# Altium project DT10965_MOTOR_CONTROLLER.PrjPcb (part 1 of 4)
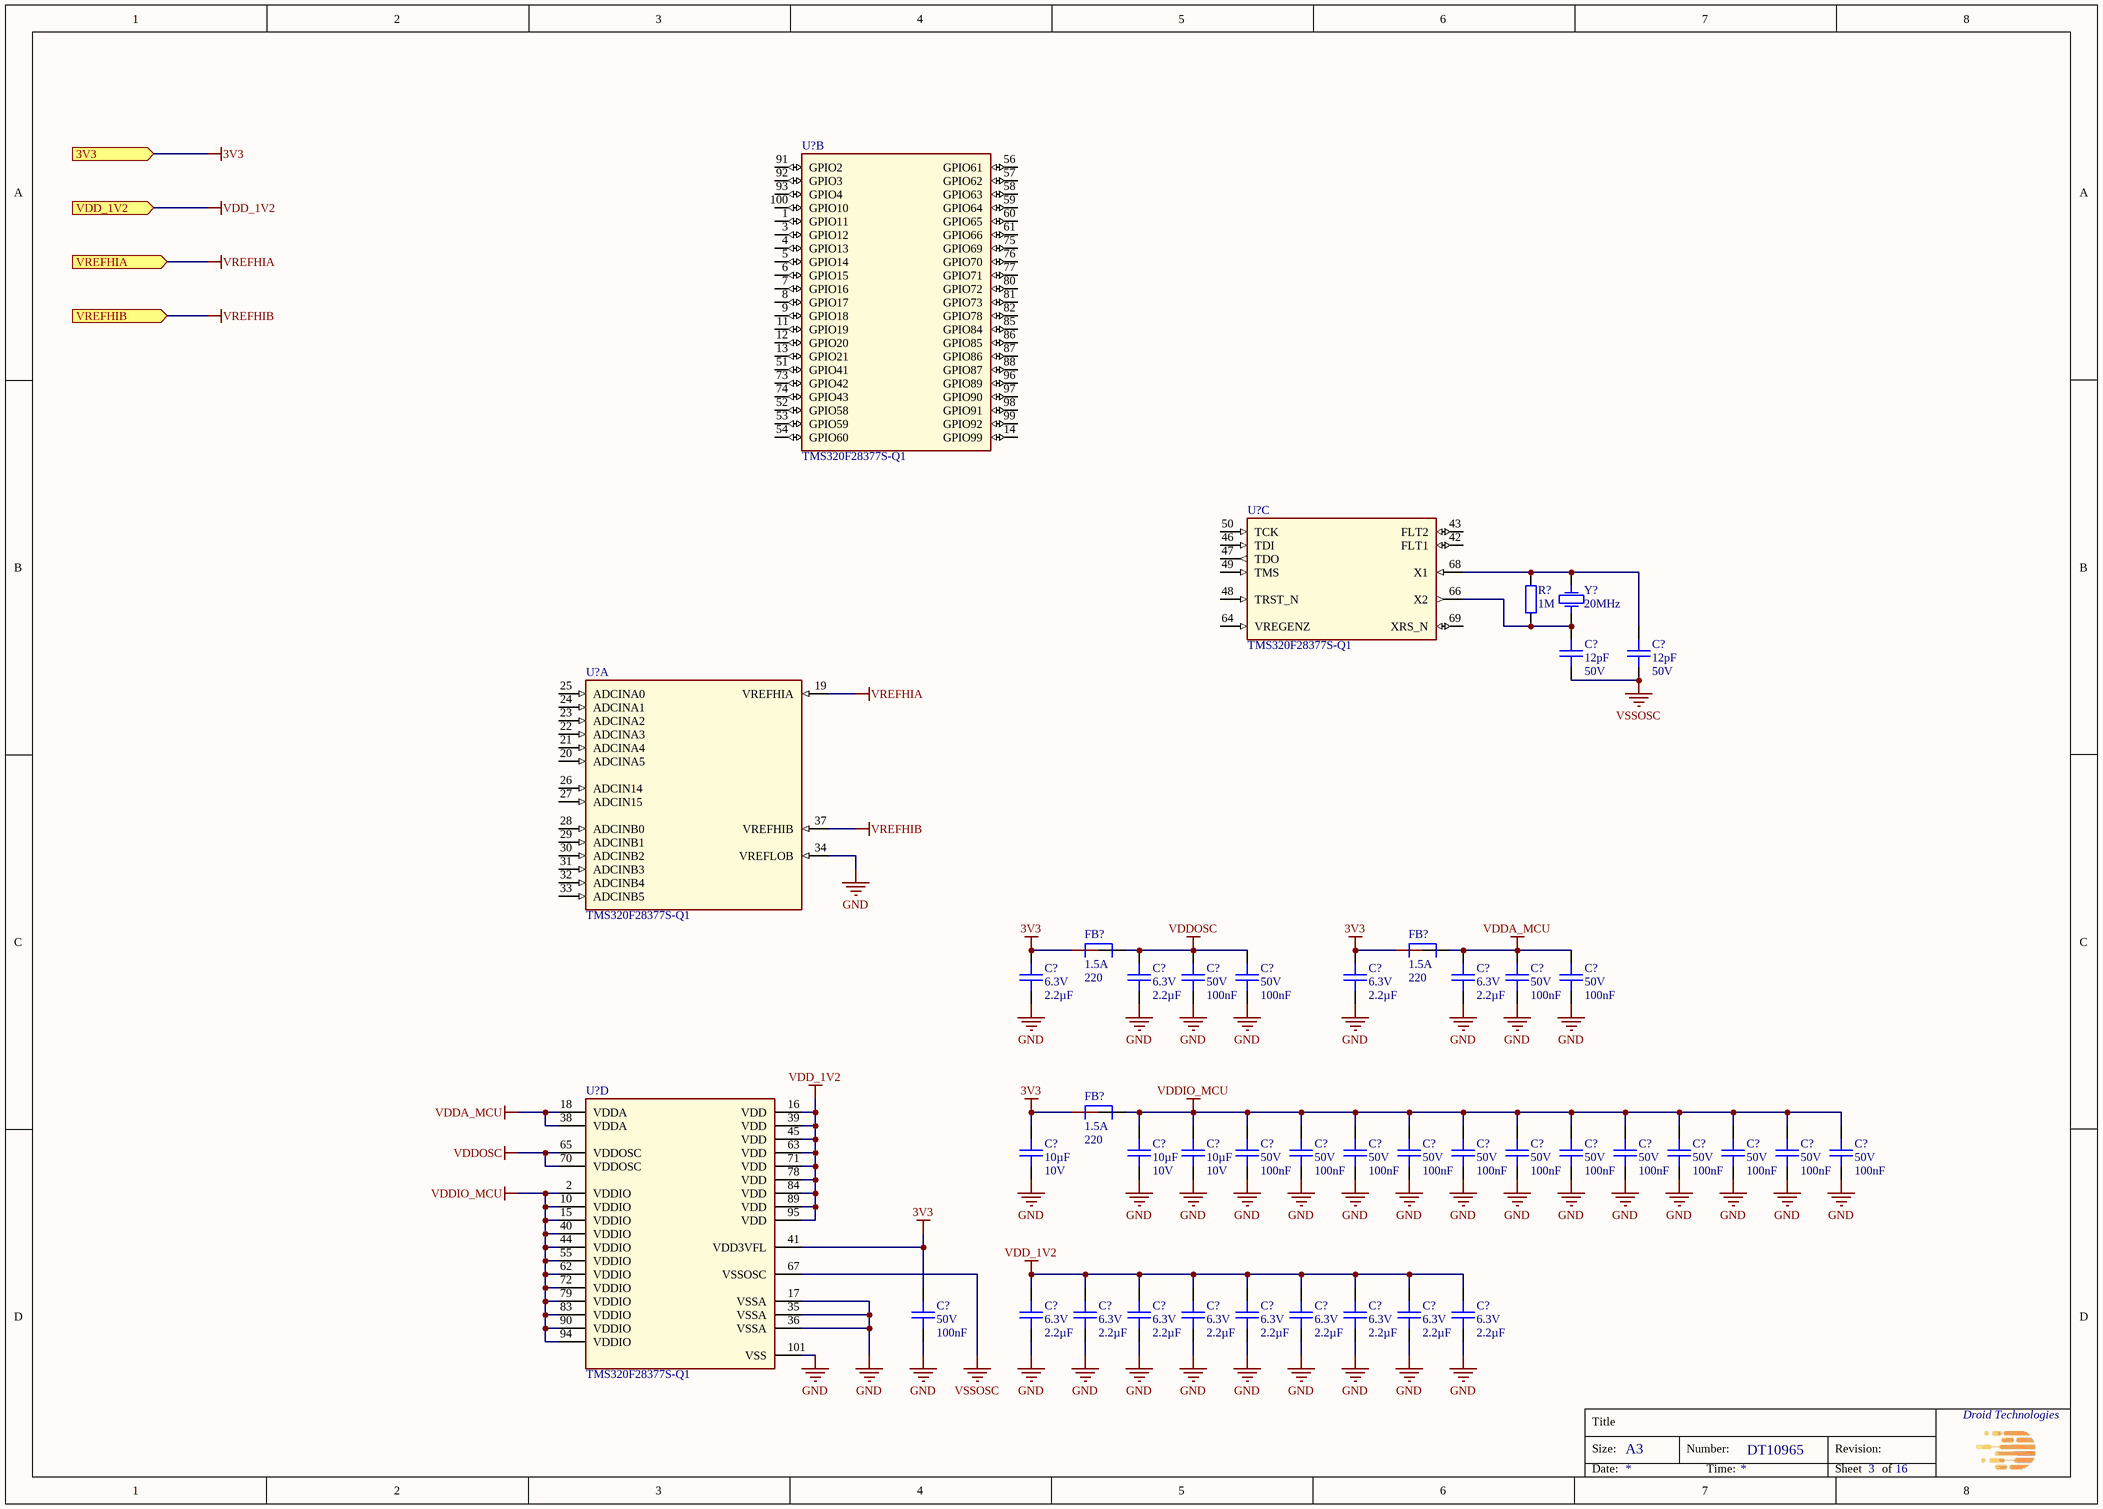
[diagram p0: MCU.SchDoc]
CompanyName: Droid Technologies; DT_PCB_Number: DT10966; DT_PCB_Revision: 1.0; DT_SCH_Number: DT10965; DT_SCH_Revision: 1.0; DT_SCH_Title: MOTORCONTROLLER
16 sheets, 439 parts. Net scope: flat (ports and power ports of the same name join across sheets).
Sheets:
  Title.SchDoc
  Block_Diagram.SchDoc
  MCU.SchDoc
  MCU_debug.SchDoc
  Flash_memory.SchDoc
  EEPROM_memory.SchDoc
  Temp_sensor.SchDoc
  Accelerometers.SchDoc
  H-bridge.SchDoc
  Phase Current_Voltage Sense.SchDoc
  Resolver.SchDoc
  Pressure_sensor_AFE.SchDoc
  Calendar.SchDoc
  Current_sensor.SchDoc
  USB_interface.SchDoc
  Power_management.SchDoc

## Sheet Title.SchDoc: =DT_SCH_Title
size A4; Organization: Droid Technologies; DocumentNumber: DT10965; Revision: 1.0

### Notes on the sheet
- SCHEMATIC MAJOR REVISION HISTORY
- SCH (PCBA) Part Number:
- PCB MAJOR REVISION HISTORY
- PCB Part Number:
- REVISION
- SUBREVISION
- CHANGE DESCRIPTION
- YYYY/MM/DD
- Title
- Size:
- A4
- Number:
- Revision:
- Date:
- Time:
- Sheet
- of

## Sheet Block_Diagram.SchDoc: =DT_SCH_Title
size A4; Organization: Droid Technologies; DocumentNumber: DT10965; Revision: 1.0

### Notes on the sheet
- Title
- Size:
- A4
- Number:
- Revision:
- Date:
- Time:
- Sheet
- of

## Sheet MCU.SchDoc: =DT_SCH_Title
size A3; Organization: Droid Technologies; DocumentNumber: DT10965; Revision: 1.0; SheetNumber: 3; SheetTotal: 16

### Parts
(Parts that share a designator on the sheet are numbered #1, #2 ... from top to bottom, then left to right.)
C?#1  Capacitance: 12pF  Voltage Rating: 50V  [CAPC100x50x50L25]  (hidden comment: C0402C120J5HACAUTO)
C?#2  Capacitance: 12pF  Voltage Rating: 50V  [CAPC100x50x50L25]  (hidden comment: C0402C120J5HACAUTO)
C?#3  Voltage Rating: 6.3V  Capacitance: 2.2µF  [CAPC160X80X90L35]  (hidden comment: C1608X8L0J225K080AC)
C?#4  Voltage Rating: 6.3V  Capacitance: 2.2µF  [CAPC160X80X90L35]  (hidden comment: C1608X8L0J225K080AC)
C?#5  Voltage Rating: 50V  Capacitance: 100nF  [CAPC100x50x50L25]  (hidden comment: GCM155L8EH104KE07D)
C?#6  Voltage Rating: 50V  Capacitance: 100nF  [CAPC100x50x50L25]  (hidden comment: GCM155L8EH104KE07D)
C?#7  Voltage Rating: 6.3V  Capacitance: 2.2µF  [CAPC160X80X90L35]  (hidden comment: C1608X8L0J225K080AC)
C?#8  Voltage Rating: 6.3V  Capacitance: 2.2µF  [CAPC160X80X90L35]  (hidden comment: C1608X8L0J225K080AC)
C?#9  Voltage Rating: 50V  Capacitance: 100nF  [CAPC100x50x50L25]  (hidden comment: GCM155L8EH104KE07D)
C?#10  Voltage Rating: 50V  Capacitance: 100nF  [CAPC100x50x50L25]  (hidden comment: GCM155L8EH104KE07D)
C?#11  Capacitance: 10µF  Voltage Rating: 10V  [CAPC200X125X145L50]  (hidden comment: CGA4J1X8L1A106K125AC)
C?#12  Capacitance: 10µF  Voltage Rating: 10V  [CAPC200X125X145L50]  (hidden comment: CGA4J1X8L1A106K125AC)
C?#13  Capacitance: 10µF  Voltage Rating: 10V  [CAPC200X125X145L50]  (hidden comment: CGA4J1X8L1A106K125AC)
C?#14  Voltage Rating: 50V  Capacitance: 100nF  [CAPC100x50x50L25]  (hidden comment: GCM155L8EH104KE07D)
C?#15  Voltage Rating: 50V  Capacitance: 100nF  [CAPC100x50x50L25]  (hidden comment: GCM155L8EH104KE07D)
C?#16  Voltage Rating: 50V  Capacitance: 100nF  [CAPC100x50x50L25]  (hidden comment: GCM155L8EH104KE07D)
C?#17  Voltage Rating: 50V  Capacitance: 100nF  [CAPC100x50x50L25]  (hidden comment: GCM155L8EH104KE07D)
C?#18  Voltage Rating: 50V  Capacitance: 100nF  [CAPC100x50x50L25]  (hidden comment: GCM155L8EH104KE07D)
C?#19  Voltage Rating: 50V  Capacitance: 100nF  [CAPC100x50x50L25]  (hidden comment: GCM155L8EH104KE07D)
C?#20  Voltage Rating: 50V  Capacitance: 100nF  [CAPC100x50x50L25]  (hidden comment: GCM155L8EH104KE07D)
C?#21  Voltage Rating: 50V  Capacitance: 100nF  [CAPC100x50x50L25]  (hidden comment: GCM155L8EH104KE07D)
C?#22  Voltage Rating: 50V  Capacitance: 100nF  [CAPC100x50x50L25]  (hidden comment: GCM155L8EH104KE07D)
C?#23  Voltage Rating: 50V  Capacitance: 100nF  [CAPC100x50x50L25]  (hidden comment: GCM155L8EH104KE07D)
C?#24  Voltage Rating: 50V  Capacitance: 100nF  [CAPC100x50x50L25]  (hidden comment: GCM155L8EH104KE07D)
C?#25  Voltage Rating: 50V  Capacitance: 100nF  [CAPC100x50x50L25]  (hidden comment: GCM155L8EH104KE07D)
C?#26  Voltage Rating: 50V  Capacitance: 100nF  [CAPC100x50x50L25]  (hidden comment: GCM155L8EH104KE07D)
C?#27  Voltage Rating: 6.3V  Capacitance: 2.2µF  [CAPC160X80X90L35]  (hidden comment: C1608X8L0J225K080AC)
C?#28  Voltage Rating: 6.3V  Capacitance: 2.2µF  [CAPC160X80X90L35]  (hidden comment: C1608X8L0J225K080AC)
C?#29  Voltage Rating: 6.3V  Capacitance: 2.2µF  [CAPC160X80X90L35]  (hidden comment: C1608X8L0J225K080AC)
C?#30  Voltage Rating: 6.3V  Capacitance: 2.2µF  [CAPC160X80X90L35]  (hidden comment: C1608X8L0J225K080AC)
C?#31  Voltage Rating: 6.3V  Capacitance: 2.2µF  [CAPC160X80X90L35]  (hidden comment: C1608X8L0J225K080AC)
C?#32  Voltage Rating: 6.3V  Capacitance: 2.2µF  [CAPC160X80X90L35]  (hidden comment: C1608X8L0J225K080AC)
C?#33  Voltage Rating: 6.3V  Capacitance: 2.2µF  [CAPC160X80X90L35]  (hidden comment: C1608X8L0J225K080AC)
C?#34  Voltage Rating: 6.3V  Capacitance: 2.2µF  [CAPC160X80X90L35]  (hidden comment: C1608X8L0J225K080AC)
C?#35  Voltage Rating: 6.3V  Capacitance: 2.2µF  [CAPC160X80X90L35]  (hidden comment: C1608X8L0J225K080AC)
FB?#1  Imax: 1.5A  Impedance: 220  [BEADC160X80X95L40]  (hidden comment: BLM18KG221BH1D)
FB?#2  Imax: 1.5A  Impedance: 220  [BEADC160X80X95L40]  (hidden comment: BLM18KG221BH1D)
FB?#3  Imax: 1.5A  Impedance: 220  [BEADC160X80X95L40]  (hidden comment: BLM18KG221BH1D)
R?#1  Resistance: 1M  [RESC100X50X40L25]  (hidden comment: RC0402FR-071ML)
U?#1  TMS320F28377S-Q1  [100-HTQFP (14x14)]  (part B of 4)
U?#2  TMS320F28377S-Q1  [100-HTQFP (14x14)]  (part C of 4)
U?#3  TMS320F28377S-Q1  [100-HTQFP (14x14)]  (part A of 4)
U?#4  TMS320F28377S-Q1  [100-HTQFP (14x14)]  (part D of 4)
Y?#1  20MHz  [NX5032GA]

### Ports
3V3 (in), VDD_1V2 (in), VREFHIA (in), VREFHIB (in)

### Nets
3V3: C?#3.2 C?#7.2 C?#11.2 C?#26.2 FB?#1.1 FB?#2.1 FB?#3.1 U?#4.41(VDD3VFL) ; port 3V3
GND: C?#3.1 C?#4.1 C?#5.1 C?#6.1 C?#7.1 C?#8.1 C?#9.1 C?#10.1 C?#11.1 C?#12.1 C?#13.1 C?#14.1 C?#15.1 C?#16.1 C?#17.1 C?#18.1 C?#19.1 C?#20.1 C?#21.1 C?#22.1 C?#23.1 C?#24.1 C?#25.1 C?#26.1 C?#27.1 C?#28.1 C?#29.1 C?#30.1 C?#31.1 C?#32.1 C?#33.1 C?#34.1 C?#35.1 U?#3.34(VREFLOB) U?#4.17(VSSA) U?#4.35(VSSA) U?#4.36(VSSA) U?#4.101(VSS)
VDD_1V2: C?#27.2 C?#28.2 C?#29.2 C?#30.2 C?#31.2 C?#32.2 C?#33.2 C?#34.2 C?#35.2 U?#4.16(VDD) U?#4.39(VDD) U?#4.45(VDD) U?#4.63(VDD) U?#4.71(VDD) U?#4.78(VDD) U?#4.84(VDD) U?#4.89(VDD) U?#4.95(VDD) ; port VDD_1V2
VDDA_MCU: C?#8.2 C?#9.2 C?#10.2 FB?#2.2 U?#4.18(VDDA) U?#4.38(VDDA)
VDDIO_MCU: C?#12.2 C?#13.2 C?#14.2 C?#15.2 C?#16.2 C?#17.2 C?#18.2 C?#19.2 C?#20.2 C?#21.2 C?#22.2 C?#23.2 C?#24.2 C?#25.2 FB?#3.2 U?#4.2(VDDIO) U?#4.10(VDDIO) U?#4.15(VDDIO) U?#4.40(VDDIO) U?#4.44(VDDIO) U?#4.55(VDDIO) U?#4.62(VDDIO) U?#4.72(VDDIO) U?#4.79(VDDIO) U?#4.83(VDDIO) U?#4.90(VDDIO) U?#4.94(VDDIO)
VDDOSC: C?#4.2 C?#5.2 C?#6.2 FB?#1.2 U?#4.65(VDDOSC) U?#4.70(VDDOSC)
VREFHIA: U?#3.19(VREFHIA) ; port VREFHIA
VREFHIB: U?#3.37(VREFHIB) ; port VREFHIB
VSSOSC: C?#1.2 C?#2.2 U?#4.67(VSSOSC)
NetC?#1_1: C?#1.1 R?#1.1 U?#2.66(X2) Y?#1.1
NetC?#2_1: C?#2.1 R?#1.2 U?#2.68(X1) Y?#1.2

Not connected (* = marked no-connect by the designer): U?#1 1(GPIO11) 3(GPIO12) 4(GPIO13) 5(GPIO14) 6(GPIO15) 7(GPIO16) 8(GPIO17) 9(GPIO18) 11(GPIO19) 12(GPIO20) 13(GPIO21) 14(GPIO99) 51(GPIO41) 52(GPIO58) 53(GPIO59) 54(GPIO60) 56(GPIO61) 57(GPIO62) 58(GPIO63) 59(GPIO64) 60(GPIO65) 61(GPIO66) 73(GPIO42) 74(GPIO43) 75(GPIO69) 76(GPIO70) 77(GPIO71) 80(GPIO72) 81(GPIO73) 82(GPIO78) 85(GPIO84) 86(GPIO85) 87(GPIO86) 88(GPIO87) 91(GPIO2) 92(GPIO3) 93(GPIO4) 96(GPIO89) 97(GPIO90) 98(GPIO91) 99(GPIO92) 100(GPIO10); U?#2 42(FLT1) 43(FLT2) 46(TDI) 47(TDO) 48(TRST_N) 49(TMS) 50(TCK) 64(VREGENZ) 69(XRS_N); U?#3 20(ADCINA5) 21(ADCINA4) 22(ADCINA3) 23(ADCINA2) 24(ADCINA1) 25(ADCINA0) 26(ADCIN14) 27(ADCIN15) 28(ADCINB0) 29(ADCINB1) 30(ADCINB2) 31(ADCINB3) 32(ADCINB4) 33(ADCINB5)

### Notes on the sheet
- Title
- Size:
- A3
- Number:
- Revision:
- Date:
- Time:
- Sheet
- of

### Library data of the parts
C?#1 C?#2 = CMP-001-2042-1: CAP CER 0402 12PF 50V ULTRA STAB; Manufacturer: KEMET; Tolerance: 5%; Op Temp min: -55°C; Dielectric: X8R; Op Temp max: 155°C; ComponentLink3URL: https://www.digikey.com/en/products/detail/kemet/C0402C120J5HACAUTO/7955501; ComponentLink1Description: Datasheet; ComponentLink2URL: https://eu.mouser.com/ProductDetail/KEMET/C0402C120J5HACAUTO?qs=j%252B1pi9TdxUZTSOjjZ2f5wA%3D%3D; Size: 1.00mm x 0.50mm; ComponentLink2Description: Mouser; Ratings: AEC-Q200; ComponentLink3Description: Digikey; Mounting Type: SM; Lead Spacing: 0mm; MPN: C0402C120J5HACAUTO; ComponentLink1URL: https://content.kemet.com/datasheets/KEM_C1007_X8R_ULTRA_150C_SMD.pdf; Height max: 500µm; Package: 0402 (1005 Metric)
C?#3 C?#4 C?#7 C?#8 C?#27-C?#35 = CMP-001-2044-1: CAP CER 2.2UF 6.3V X8L 0603; Manufacturer: TDK Corporation; Op Temp min: -55°C; Tolerance: 10%; Op Temp max: 150°C; ComponentLink1URL: https://product.tdk.com/en/search/capacitor/ceramic/mlcc/info?part_no=C1608X8L0J225K080AC; MPN: C1608X8L0J225K080AC; ComponentLink3URL: https://www.digikey.com/en/products/detail/tdk-corporation/C1608X8L0J225K080AC/8343784; ComponentLink1Description: Datasheet; Lead Spacing: 0mm; ComponentLink3Description: Digikey; Package: 0603 (1608 Metric); Height max: 900µm; Size: 1.60mm x 0.80mm; Dielectric: X8L; Ratings: -; Mounting Type: SM; ComponentLink2URL: https://eu.mouser.com/ProductDetail/TDK/C1608X8L0J225K080AC?qs=rrS6PyfT74dgREMaiAoT3Q%3D%3D; ComponentLink2Description: Mouser
C?#5 C?#6 C?#9 C?#10 C?#14-C?#26 = CMP-001-1980-1: CAP CER 0.1UF 50V X8L 0402; Manufacturer: Murata Electronics; Op Temp max: 150°C; Op Temp min: -55°C; Tolerance: 10%; Height max: 550µm; ComponentLink3Description: Digikey; Mounting Type: SM; ComponentLink3URL: https://www.digikey.com/en/products/detail/murata-electronics/GCM155L8EH104KE07D/11618823; Package: 0402 (1005 Metric); Lead Spacing: 0mm; MPN: GCM155L8EH104KE07D; Size: 1.00mm x 0.50mm; Ratings: AEC-Q200; ComponentLink1URL: https://search.murata.co.jp/Ceramy/image/img/A01X/G101/ENG/GCM155L8EH104KE07-01.pdf; ComponentLink1Description: Datasheet; Dielectric: X8L; ComponentLink2Description: Mouser; ComponentLink2URL: https://eu.mouser.com/ProductDetail/Murata-Electronics/GCM155L8EH104KE07D?qs=1mbolxNpo8fQSHf0HYnZWw%3D%3D
C?#11-C?#13 = CMP-001-1984-1: CAP CER 10UF 10V X8L 0805; Manufacturer: TDK Corporation; Tolerance: 10%; Op Temp min: -55°C; Op Temp max: 150°C; ComponentLink3Description: Digikey; Mounting Type: SM; Ratings: AEC-Q200; ComponentLink1Description: Datasheet; ComponentLink3URL: https://www.digikey.com/en/products/detail/tdk-corporation/CGA4J1X8L1A106K125AC/9991388; Lead Spacing: 0mm; MPN: CGA4J1X8L1A106K125AC; Size: 2.00mm x 1.25mm; Height max: 1.5mm; ComponentLink2URL: https://eu.mouser.com/ProductDetail/TDK/CGA4J1X8L1A106K125AC?qs=gZXFycFWdANzH%252B2UvJJjtQ%3D%3D; Package: 0805 (2012 Metric); ComponentLink2Description: Mouser; Dielectric: X8L; ComponentLink1URL: https://product.tdk.com/system/files/dam/doc/product/capacitor/ceramic/mlcc/catalog/mlcc_automotive_hightemp_en.pdf
FB?#1-FB?#3 = CMP-001-1981-1: FERRITE BEAD 220 OHM 0603 1LN; Manufacturer: Murata Electronics; DCR: 50m; Op Temp min: -55°C; Frequency: 100MHz; Op Temp max: 150°C; Number of Lines: 1; Mounting Type: SM; Size: 1.60mm x 0.80mm; ComponentLink2URL: https://eu.mouser.com/ProductDetail/Murata-Electronics/BLM18KG221BH1D?qs=sJ5gq5MLFXpgEHYBdWUtkQ%3D%3D; ComponentLink1Description: Datasheet; ComponentLink1URL: https://www.murata.com/en-us/products/productdata/8798137286686/QNFA9129.pdf; Lead Spacing: 0mm; Ratings: AEC-Q200; ComponentLink3Description: Digikey; ComponentLink3URL: https://www.digikey.com/en/products/detail/murata-electronics/BLM18KG221BH1D/6156000; Height max: 950µm; Package: 0603 (1608 Metric); ComponentLink2Description: Mouser; MPN: BLM18KG221BH1D
R?#1 = CMP-00539-4: RES 1M OHM 1% 1/16W 0402; Manufacturer: YAGEO; Op Temp max: 155°C; Op Temp min: -55°C; Temperature Coefficient: ±100ppm; Power: 63mW; Ratings: -; ComponentLink2URL: https://eu.mouser.com/ProductDetail/YAGEO/RC0402FR-071ML?qs=V1yeUXFNrknfoI4987wfBQ%3D%3D; Height max: 400µm; ComponentLink1Description: Datasheet; Mounting Type: SM; ComponentLink2Description: Mouser; Package: 0402 (1005 Metric); ComponentLink3URL: https://www.digikey.com/en/products/detail/yageo/RC0402FR-071ML/726515; MPN: RC0402FR-071ML; Tolerance: 1%; ComponentLink1URL: https://www.yageo.com/upload/media/product/productsearch/datasheet/rchip/PYu-RC_Group_51_RoHS_L_12.pdf; Composition: Thick Film; Size: 1.00mm x 0.50mm; ComponentLink3Description: Digikey
U?#1-U?#4 = TMS320F28377SPZPQ: IC MCU 32BIT 1MB FLASH 100HTQFP; Manufacturer: Texas Instruments; MPN: TMS320F28377SPZPQ
Y?#1 = STDCSU2-20M: CRYSTAL 20.0000MHZ 8PF SMD; Manufacturer: NDK (NIHON DEMPA KOGYO CO., LTD); MPN: STDCSU2-20M

## Sheet MCU_debug.SchDoc: =DT_SCH_Title
size A4; Organization: Droid Technologies; DocumentNumber: DT10965; Revision: 1.0; SheetNumber: 4; SheetTotal: 15
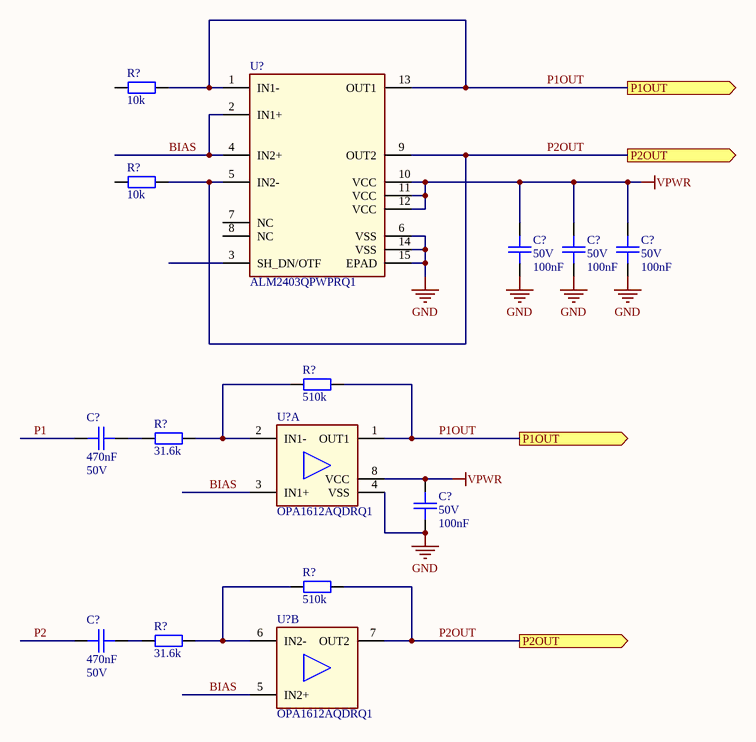
[diagram p1: MCU_debug.SchDoc]

### Parts
(Parts that share a designator on the sheet are numbered #1, #2 ... from top to bottom, then left to right.)
C?#36  Voltage Rating: 50V  Capacitance: 100nF  [CAPC100x50x50L25]  (hidden comment: GCM155L8EH104KE07D)
C?#37  Voltage Rating: 50V  Capacitance: 100nF  [CAPC100x50x50L25]  (hidden comment: GCM155L8EH104KE07D)
C?#38  Voltage Rating: 50V  Capacitance: 100nF  [CAPC100x50x50L25]  (hidden comment: GCM155L8EH104KE07D)
C?#39  Capacitance: 470nF  Voltage Rating: 50V  [CAPC200X125X145L50]  (hidden comment: CGA4J1X8L1H474K125AC)
C?#40  Voltage Rating: 50V  Capacitance: 100nF  [CAPC100x50x50L25]  (hidden comment: GCM155L8EH104KE07D)
C?#41  Capacitance: 470nF  Voltage Rating: 50V  [CAPC200X125X145L50]  (hidden comment: CGA4J1X8L1H474K125AC)
R?#2  Resistance: 10k  [RESC100X50X40L25]  (hidden comment: RC0402FR-0710KL)
R?#3  Resistance: 10k  [RESC100X50X40L25]  (hidden comment: RC0402FR-0710KL)
R?#4  Resistance: 510k  [RESC100X50X40L25]  (hidden comment: RC0402FR-07510KL)
R?#5  Resistance: 31.6k  [RESC100X50X40L25]  (hidden comment: RC0402FR-0731K6L)
R?#6  Resistance: 510k  [RESC100X50X40L25]  (hidden comment: RC0402FR-07510KL)
R?#7  Resistance: 31.6k  [RESC100X50X40L25]  (hidden comment: RC0402FR-0731K6L)
U?#5  ALM2403QPWPRQ1  [14-HTSSOP]
U?#6  OPA1612AQDRQ1  [SOIC8P127_490X600X175L70X41]  (part A of 2)
U?#7  OPA1612AQDRQ1  [SOIC8P127_490X600X175L70X41]  (part B of 2)

### Ports
P1OUT (out), P2OUT (out)

### Nets
GND: C?#36.1 C?#37.1 C?#38.1 C?#40.1 U?#5.6(VSS) U?#5.14(VSS) U?#5.15(EPAD) U?#6.4(VSS)
VPWR: C?#36.2 C?#37.2 C?#38.2 C?#40.2 U?#5.10(VCC) U?#5.11(VCC) U?#5.12(VCC) U?#6.8(VCC)
BIAS: U?#5.2(IN1+) U?#5.4(IN2+) U?#6.3(IN1+) U?#7.5(IN2+)
P1: C?#39.2
P1OUT: R?#2.1 R?#4.2 U?#5.1(IN1-) U?#5.13(OUT1) U?#6.1(OUT1) ; port P1OUT
P2: C?#41.2
P2OUT: R?#3.1 R?#6.2 U?#5.5(IN2-) U?#5.9(OUT2) U?#7.7(OUT2) ; port P2OUT
NetC?#39_1: C?#39.1 R?#5.1
NetC?#41_1: C?#41.1 R?#7.1
NetR?#4_1: R?#4.1 R?#5.2 U?#6.2(IN1-)
NetR?#6_1: R?#6.1 R?#7.2 U?#7.6(IN2-)

Not connected (* = marked no-connect by the designer): R?#2 2; R?#3 2; U?#5 3(SH_DN/OTF) 7(NC) 8(NC)

### Notes on the sheet
- Title
- Size:
- A4
- Number:
- Revision:
- Date:
- Time:
- Sheet
- of

### Library data of the parts
C?#36-C?#38 C?#40 = CMP-001-1980-1: as C?#5 on sheet MCU; Height max: 550µm; ComponentLink3Description: Digikey; Mounting Type: SM; ComponentLink3URL: https://www.digikey.com/en/products/detail/murata-electronics/GCM155L8EH104KE07D/11618823; Package: 0402 (1005 Metric); Lead Spacing: 0mm; MPN: GCM155L8EH104KE07D; Size: 1.00mm x 0.50mm; Ratings: AEC-Q200; ComponentLink1URL: https://search.murata.co.jp/Ceramy/image/img/A01X/G101/ENG/GCM155L8EH104KE07-01.pdf; ComponentLink1Description: Datasheet; Dielectric: X8L; ComponentLink2Description: Mouser; ComponentLink2URL: https://eu.mouser.com/ProductDetail/Murata-Electronics/GCM155L8EH104KE07D?qs=1mbolxNpo8fQSHf0HYnZWw%3D%3D
C?#39 C?#41 = CMP-001-2015-1: CAP CER 0.47UF 50V X8L 0805; Manufacturer: TDK Corporation; Op Temp min: -55°C; Tolerance: 10%; Op Temp max: 150°C; ComponentLink1Description: Datasheet; Size: 2.00mm x 1.25mm; Dielectric: X8L; ComponentLink3URL: https://www.digikey.com/en/products/detail/tdk-corporation/CGA4J1X8L1H474K125AC/12807037?s=N4IgjCBcoKxaBjKAzAhgGwM4FMA0IB7KAbRAGYYAWAdgA5KQBdfABwBcoQBlNgJwEsAdgHMQAX3xgG0EEkhoseQiRAAmMrWoamrDpG58hoieABs8WSgw58RSKTIBOMqsc6Q7TjwEjx%2BU24ycgo2yvYglAAMjpRg5sweegY%2BxviqMKoWwdZKdqSqlK5kEGmFztQgpa6xlWpllLTunvreRn7gjrSBiFaKtiqRTCaqkZTdlvI5-eGRAHQ0AAQArQBitTSRC4JrCc0gAKqC-GwA8sgAstiomACuvNjtALSZQVB8N7kqcPhujCaP4zk70%2B4QgfzEYiAA; Ratings: AEC-Q200; ComponentLink3Description: Digikey; ComponentLink2Description: Mouser; Mounting Type: SM; Lead Spacing: 0mm; ComponentLink1URL: https://product.tdk.com/system/files/dam/doc/product/capacitor/ceramic/mlcc/catalog/mlcc_automotive_hightemp_en.pdf; MPN: CGA4J1X8L1H474K125AC; Height max: 1.45mm; ComponentLink2URL: https://eu.mouser.com/ProductDetail/TDK/CGA4J1X8L1H474K125AC?qs=W%2FMpXkg%252BdQ5d8zdfD6mokw%3D%3D; Package: 0805 (2012 Metric)
R?#2 R?#3 = CMP-00010-6: RES 10K OHM 1% 1/16W 0402; Manufacturer: YAGEO; Op Temp max: 155°C; Op Temp min: -55°C; Power: 63mW; Temperature Coefficient: ±100ppm; ComponentLink3URL: https://www.digikey.com/en/products/detail/yageo/RC0402FR-0710KL/726523; ComponentLink1Description: Datasheet; Height max: 400µm; ComponentLink3Description: Digikey; ComponentLink2URL: https://www2.mouser.com/ProductDetail/YAGEO/RC0402FR-0710KL?qs=%2Fha2pyFaduhjtLcYvKXQ8NAGbRXkQ%2Fwl6RsvWHeV66MSeqLhkcF3rg%3D%3D; Ratings: -; MPN: RC0402FR-0710KL; ComponentLink1URL: https://www.yageo.com/upload/media/product/productsearch/datasheet/rchip/PYu-RC_Group_51_RoHS_L_12.pdf; ComponentLink2Description: Mouser; Mounting Type: SM; Tolerance: 1%; Composition: Thick Film; Size: 1.00mm x 0.50mm; Package: 0402 (1005 Metric)
R?#4 R?#6 = CMP-001-0533-6: RES 510K OHM 1% 1/16W 0402; Manufacturer: YAGEO; Op Temp max: 155°C; Temperature Coefficient: ±100ppm; Op Temp min: -55°C; Power: 63mW; Package: 0402 (1005 Metric); Composition: Thick Film; Size: 1.00mm x 0.50mm; ComponentLink2Description: Mouser; MPN: RC0402FR-07510KL; Height max: 400µm; ComponentLink1URL: https://www.yageo.com/upload/media/product/productsearch/datasheet/rchip/PYu-RC_Group_51_RoHS_L_12.pdf; ComponentLink2URL: https://eu.mouser.com/ProductDetail/YAGEO/RC0402FR-07510KL?qs=V1yeUXFNrkkq0IeA5n8CcA%3D%3D; Tolerance: 1%; Mounting Type: SM; ComponentLink3Description: Digikey; ComponentLink3URL: https://www.digikey.com/en/products/detail/yageo/RC0402FR-07510KL/726631; Ratings: -; ComponentLink1Description: Datasheet
R?#5 R?#7 = CMP-00475-6: RES 31.6K OHM 1% 1/16W 0402; Manufacturer: YAGEO; Power: 63mW; Temperature Coefficient: ±100ppm; Op Temp max: 155°C; Op Temp min: -55°C; ComponentLink2Description: Mouser; Size: 1.00mm x 0.50mm; ComponentLink3URL: https://www.digikey.com/en/products/detail/yageo/RC0402FR-0731K6L/5280975; Composition: Thick Film; Mounting Type: SM; ComponentLink1URL: https://www.yageo.com/upload/media/product/productsearch/datasheet/rchip/PYu-RC_Group_51_RoHS_L_12.pdf; Tolerance: 1%; ComponentLink3Description: Digikey; MPN: RC0402FR-0731K6L; ComponentLink1Description: Datasheet; Ratings: -; ComponentLink2URL: https://eu.mouser.com/ProductDetail/YAGEO/RC0402FR-0731K6L?qs=tQYgeJ5sXdm2wsAqEjplmg%3D%3D; Package: 0402 (1005 Metric); Height max: 400µm
U?#5 = ALM2403QPWPRQ1: IC OPAMP GP 2 CIRCUIT 14HTSSOP; Manufacturer: Texas Instruments; MPN: ALM2403QPWPRQ1
U?#6 U?#7 = CMP-001-2012-1: IC AUDIO 2 CIRCUIT 8SOIC; Manufacturer: Texas Instruments; Vmax: 36V; Op Temp min: -40°C; Io: 62mA; Output Type: Rail-to-Rail; Vmin: 4.5V; Vos: 100µV; SR: 27V/µs; Op Temp max: 125°C; GBW: 80MHz; Number of Circuits: 2; ComponentLink2Description: Mouser; ComponentLink2URL: https://eu.mouser.com/ProductDetail/Texas-Instruments/OPA1612AQDRQ1?qs=8%2FmU9qzJpL88MwkHDflokw%3D%3D; Mounting Type: SM; Ratings: AEC-Q100; ComponentLink1Description: Datasheet; ComponentLink3Description: Digikey; Package: 8-SOIC (0.154", 3.90mm Width); ComponentLink3URL: https://www.digikey.com/en/products/detail/texas-instruments/OPA1612AQDRQ1/5773903?s=N4IgjCBcoEwKwyqAxlAZgQwDYGcCmANCAPZQDaIMYMALAOwAcIAukQA4AuUIAyhwE4BLAHYBzEAF8iAWkTQQqSAICuhEuRBwQRAJwsJUyhoDyABQCCYAGzV9QA; MPN: OPA1612AQDRQ1; ComponentLink1URL: https://www.ti.com/lit/ds/symlink/opa1612-q1.pdf?HQS=dis-dk-null-digikeymode-dsf-pf-null-wwe&ts=1746955758664&ref_url=https%253A%252F%252Fwww.ti.com%252Fgeneral%252Fdocs%252Fsuppproductinfo.tsp%253FdistId%253D10%2526gotoUrl%253Dhttps%253A%252F%252Fwww.ti.com%252Flit%252Fgpn%252Fopa1612-q1

## Sheet Flash_memory.SchDoc: =DT_SCH_Title
size A3; Organization: Droid Technologies; DocumentNumber: DT10965; Revision: 1.0
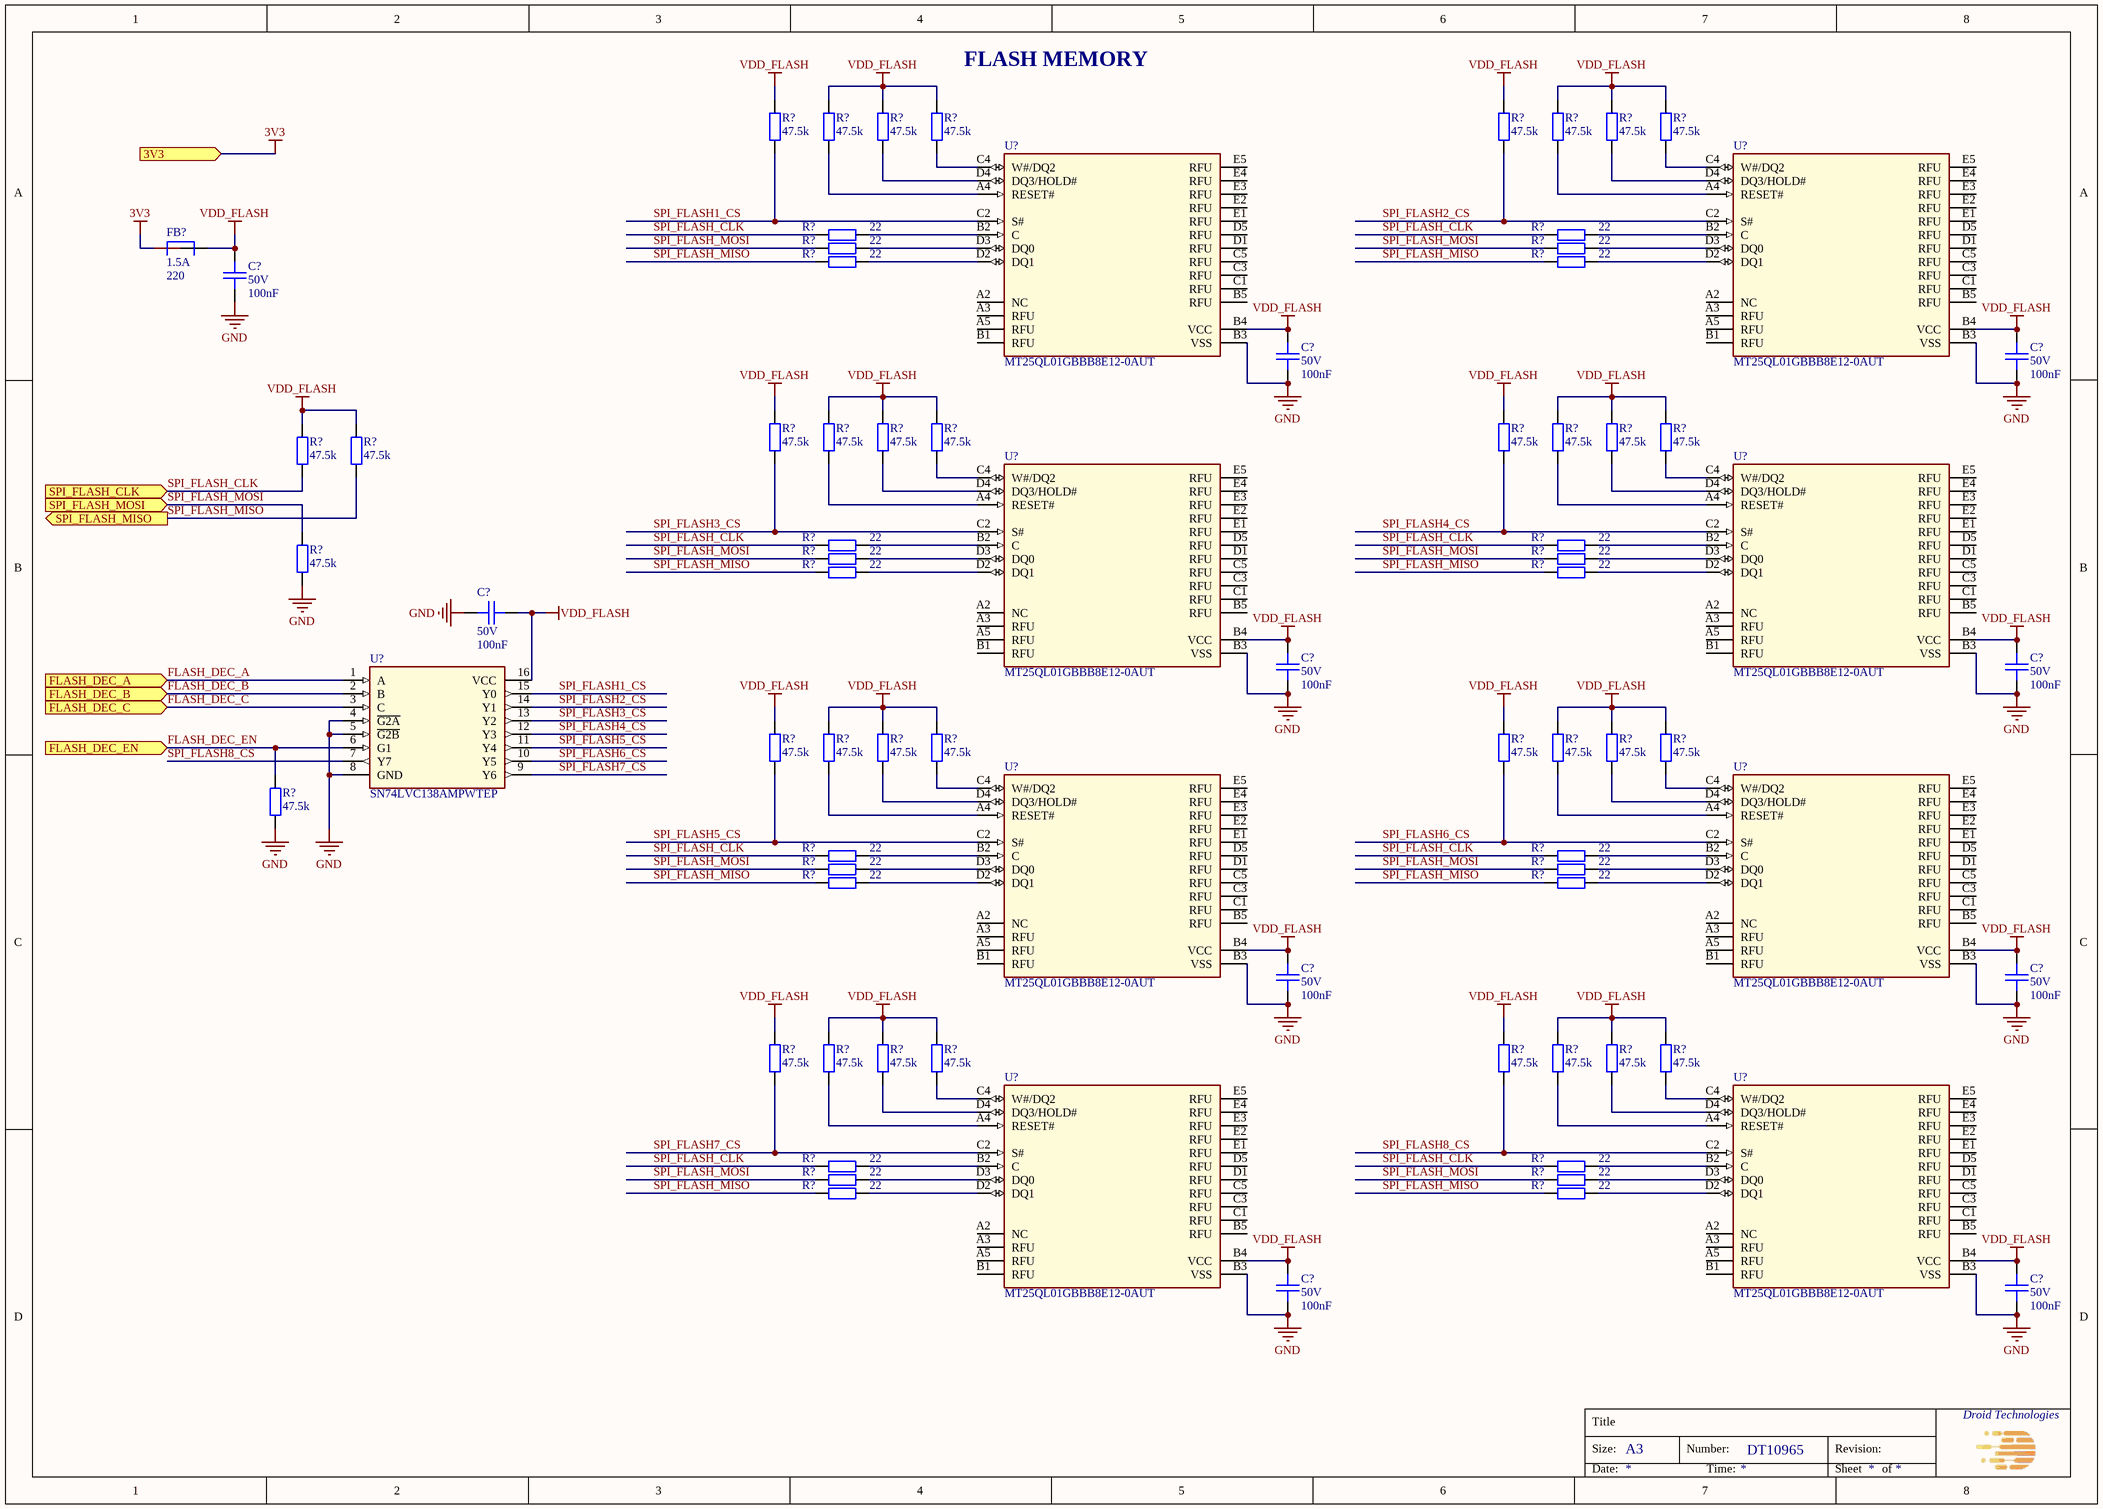
[diagram p2: Flash_memory.SchDoc]

### Parts
(Parts that share a designator on the sheet are numbered #1, #2 ... from top to bottom, then left to right.)
C?#42  Voltage Rating: 50V  Capacitance: 100nF  [CAPC100x50x50L25]  (hidden comment: GCM155L8EH104KE07D)
C?#43  Voltage Rating: 50V  Capacitance: 100nF  [CAPC100x50x50L25]  (hidden comment: GCM155L8EH104KE07D)
C?#44  Voltage Rating: 50V  Capacitance: 100nF  [CAPC100x50x50L25]  (hidden comment: GCM155L8EH104KE07D)
C?#45  Voltage Rating: 50V  Capacitance: 100nF  [CAPC100x50x50L25]  (hidden comment: GCM155L8EH104KE07D)
C?#46  Voltage Rating: 50V  Capacitance: 100nF  [CAPC100x50x50L25]  (hidden comment: GCM155L8EH104KE07D)
C?#47  Voltage Rating: 50V  Capacitance: 100nF  [CAPC100x50x50L25]  (hidden comment: GCM155L8EH104KE07D)
C?#48  Voltage Rating: 50V  Capacitance: 100nF  [CAPC100x50x50L25]  (hidden comment: GCM155L8EH104KE07D)
C?#49  Voltage Rating: 50V  Capacitance: 100nF  [CAPC100x50x50L25]  (hidden comment: GCM155L8EH104KE07D)
C?#50  Voltage Rating: 50V  Capacitance: 100nF  [CAPC100x50x50L25]  (hidden comment: GCM155L8EH104KE07D)
C?#51  Voltage Rating: 50V  Capacitance: 100nF  [CAPC100x50x50L25]  (hidden comment: GCM155L8EH104KE07D)
FB?#4  Imax: 1.5A  Impedance: 220  [BEADC160X80X95L40]  (hidden comment: BLM18KG221BH1D)
R?#8  Resistance: 47.5k  [RESC100X50X40L25]  (hidden comment: RC0402FR-0747K5L)
R?#9  Resistance: 47.5k  [RESC100X50X40L25]  (hidden comment: RC0402FR-0747K5L)
R?#10  Resistance: 47.5k  [RESC100X50X40L25]  (hidden comment: RC0402FR-0747K5L)
R?#11  Resistance: 47.5k  [RESC100X50X40L25]  (hidden comment: RC0402FR-0747K5L)
R?#12  Resistance: 47.5k  [RESC100X50X40L25]  (hidden comment: RC0402FR-0747K5L)
R?#13  Resistance: 47.5k  [RESC100X50X40L25]  (hidden comment: RC0402FR-0747K5L)
R?#14  Resistance: 47.5k  [RESC100X50X40L25]  (hidden comment: RC0402FR-0747K5L)
R?#15  Resistance: 47.5k  [RESC100X50X40L25]  (hidden comment: RC0402FR-0747K5L)
R?#16  Resistance: 22  [RESC100X50X40L25]  (hidden comment: RC0402FR-0722RL)
R?#17  Resistance: 22  [RESC100X50X40L25]  (hidden comment: RC0402FR-0722RL)
R?#18  Resistance: 22  [RESC100X50X40L25]  (hidden comment: RC0402FR-0722RL)
R?#19  Resistance: 22  [RESC100X50X40L25]  (hidden comment: RC0402FR-0722RL)
R?#20  Resistance: 22  [RESC100X50X40L25]  (hidden comment: RC0402FR-0722RL)
R?#21  Resistance: 22  [RESC100X50X40L25]  (hidden comment: RC0402FR-0722RL)
R?#22  Resistance: 47.5k  [RESC100X50X40L25]  (hidden comment: RC0402FR-0747K5L)
R?#23  Resistance: 47.5k  [RESC100X50X40L25]  (hidden comment: RC0402FR-0747K5L)
R?#24  Resistance: 47.5k  [RESC100X50X40L25]  (hidden comment: RC0402FR-0747K5L)
R?#25  Resistance: 47.5k  [RESC100X50X40L25]  (hidden comment: RC0402FR-0747K5L)
R?#26  Resistance: 47.5k  [RESC100X50X40L25]  (hidden comment: RC0402FR-0747K5L)
R?#27  Resistance: 47.5k  [RESC100X50X40L25]  (hidden comment: RC0402FR-0747K5L)
R?#28  Resistance: 47.5k  [RESC100X50X40L25]  (hidden comment: RC0402FR-0747K5L)
R?#29  Resistance: 47.5k  [RESC100X50X40L25]  (hidden comment: RC0402FR-0747K5L)
R?#30  Resistance: 47.5k  [RESC100X50X40L25]  (hidden comment: RC0402FR-0747K5L)
R?#31  Resistance: 47.5k  [RESC100X50X40L25]  (hidden comment: RC0402FR-0747K5L)
R?#32  Resistance: 22  [RESC100X50X40L25]  (hidden comment: RC0402FR-0722RL)
R?#33  Resistance: 22  [RESC100X50X40L25]  (hidden comment: RC0402FR-0722RL)
R?#34  Resistance: 22  [RESC100X50X40L25]  (hidden comment: RC0402FR-0722RL)
R?#35  Resistance: 22  [RESC100X50X40L25]  (hidden comment: RC0402FR-0722RL)
R?#36  Resistance: 22  [RESC100X50X40L25]  (hidden comment: RC0402FR-0722RL)
R?#37  Resistance: 22  [RESC100X50X40L25]  (hidden comment: RC0402FR-0722RL)
R?#38  Resistance: 47.5k  [RESC100X50X40L25]  (hidden comment: RC0402FR-0747K5L)
R?#39  Resistance: 47.5k  [RESC100X50X40L25]  (hidden comment: RC0402FR-0747K5L)
R?#40  Resistance: 47.5k  [RESC100X50X40L25]  (hidden comment: RC0402FR-0747K5L)
R?#41  Resistance: 47.5k  [RESC100X50X40L25]  (hidden comment: RC0402FR-0747K5L)
R?#42  Resistance: 47.5k  [RESC100X50X40L25]  (hidden comment: RC0402FR-0747K5L)
R?#43  Resistance: 47.5k  [RESC100X50X40L25]  (hidden comment: RC0402FR-0747K5L)
R?#44  Resistance: 47.5k  [RESC100X50X40L25]  (hidden comment: RC0402FR-0747K5L)
R?#45  Resistance: 47.5k  [RESC100X50X40L25]  (hidden comment: RC0402FR-0747K5L)
R?#46  Resistance: 47.5k  [RESC100X50X40L25]  (hidden comment: RC0402FR-0747K5L)
R?#47  Resistance: 47.5k  [RESC100X50X40L25]  (hidden comment: RC0402FR-0747K5L)
R?#48  Resistance: 22  [RESC100X50X40L25]  (hidden comment: RC0402FR-0722RL)
R?#49  Resistance: 22  [RESC100X50X40L25]  (hidden comment: RC0402FR-0722RL)
R?#50  Resistance: 22  [RESC100X50X40L25]  (hidden comment: RC0402FR-0722RL)
R?#51  Resistance: 22  [RESC100X50X40L25]  (hidden comment: RC0402FR-0722RL)
R?#52  Resistance: 22  [RESC100X50X40L25]  (hidden comment: RC0402FR-0722RL)
R?#53  Resistance: 22  [RESC100X50X40L25]  (hidden comment: RC0402FR-0722RL)
R?#54  Resistance: 47.5k  [RESC100X50X40L25]  (hidden comment: RC0402FR-0747K5L)
R?#55  Resistance: 47.5k  [RESC100X50X40L25]  (hidden comment: RC0402FR-0747K5L)
R?#56  Resistance: 47.5k  [RESC100X50X40L25]  (hidden comment: RC0402FR-0747K5L)
R?#57  Resistance: 47.5k  [RESC100X50X40L25]  (hidden comment: RC0402FR-0747K5L)
R?#58  Resistance: 47.5k  [RESC100X50X40L25]  (hidden comment: RC0402FR-0747K5L)
R?#59  Resistance: 47.5k  [RESC100X50X40L25]  (hidden comment: RC0402FR-0747K5L)
R?#60  Resistance: 47.5k  [RESC100X50X40L25]  (hidden comment: RC0402FR-0747K5L)
R?#61  Resistance: 47.5k  [RESC100X50X40L25]  (hidden comment: RC0402FR-0747K5L)
R?#62  Resistance: 22  [RESC100X50X40L25]  (hidden comment: RC0402FR-0722RL)
R?#63  Resistance: 22  [RESC100X50X40L25]  (hidden comment: RC0402FR-0722RL)
R?#64  Resistance: 22  [RESC100X50X40L25]  (hidden comment: RC0402FR-0722RL)
R?#65  Resistance: 22  [RESC100X50X40L25]  (hidden comment: RC0402FR-0722RL)
R?#66  Resistance: 22  [RESC100X50X40L25]  (hidden comment: RC0402FR-0722RL)
R?#67  Resistance: 22  [RESC100X50X40L25]  (hidden comment: RC0402FR-0722RL)
U?#8  MT25QL01GBBB8E12-0AUT  [24-T-PBGA (6x8)]
U?#9  MT25QL01GBBB8E12-0AUT  [24-T-PBGA (6x8)]
U?#10  MT25QL01GBBB8E12-0AUT  [24-T-PBGA (6x8)]
U?#11  MT25QL01GBBB8E12-0AUT  [24-T-PBGA (6x8)]
U?#12  SN74LVC138AMPWTEP  [TSSOP16]
U?#13  MT25QL01GBBB8E12-0AUT  [24-T-PBGA (6x8)]
U?#14  MT25QL01GBBB8E12-0AUT  [24-T-PBGA (6x8)]
U?#15  MT25QL01GBBB8E12-0AUT  [24-T-PBGA (6x8)]
U?#16  MT25QL01GBBB8E12-0AUT  [24-T-PBGA (6x8)]

### Ports
3V3 (in), FLASH_DEC_A (in), FLASH_DEC_B (in), FLASH_DEC_C (in), FLASH_DEC_EN (in), SPI_FLASH_CLK (in), SPI_FLASH_MISO (out), SPI_FLASH_MOSI (in)

### Nets
3V3: FB?#4.1 ; port 3V3
GND: C?#42.1 C?#43.1 C?#44.1 C?#45.1 C?#46.1 C?#47.1 C?#48.1 C?#49.1 C?#50.1 C?#51.1 R?#38.1 R?#47.1 U?#8.B3(VSS) U?#9.B3(VSS) U?#10.B3(VSS) U?#11.B3(VSS) U?#12.4(~{G2A}) U?#12.5(~{G2B}) U?#12.8(GND) U?#13.B3(VSS) U?#14.B3(VSS) U?#15.B3(VSS) U?#16.B3(VSS)
VDD_FLASH: C?#42.2 C?#43.2 C?#44.2 C?#45.2 C?#46.2 C?#47.2 C?#48.2 C?#49.2 C?#50.2 C?#51.2 FB?#4.2 R?#8.2 R?#9.2 R?#10.2 R?#11.2 R?#12.2 R?#13.2 R?#14.2 R?#15.2 R?#22.2 R?#23.2 R?#24.2 R?#25.2 R?#26.2 R?#27.2 R?#28.2 R?#29.2 R?#30.2 R?#31.2 R?#39.2 R?#40.2 R?#41.2 R?#42.2 R?#43.2 R?#44.2 R?#45.2 R?#46.2 R?#54.2 R?#55.2 R?#56.2 R?#57.2 R?#58.2 R?#59.2 R?#60.2 R?#61.2 U?#8.B4(VCC) U?#9.B4(VCC) U?#10.B4(VCC) U?#11.B4(VCC) U?#12.16(VCC) U?#13.B4(VCC) U?#14.B4(VCC) U?#15.B4(VCC) U?#16.B4(VCC)
FLASH_DEC_A: U?#12.1(A) ; port FLASH_DEC_A
FLASH_DEC_B: U?#12.2(B) ; port FLASH_DEC_B
FLASH_DEC_C: U?#12.3(C) ; port FLASH_DEC_C
FLASH_DEC_EN: R?#47.2 U?#12.6(G1) ; port FLASH_DEC_EN
SPI_FLASH1_CS: R?#8.1 U?#8.C2(S#) U?#12.15(Y0)
SPI_FLASH2_CS: R?#12.1 U?#9.C2(S#) U?#12.14(Y1)
SPI_FLASH3_CS: R?#22.1 U?#10.C2(S#) U?#12.13(Y2)
SPI_FLASH4_CS: R?#26.1 U?#11.C2(S#) U?#12.12(Y3)
SPI_FLASH5_CS: R?#39.1 U?#12.11(Y4) U?#13.C2(S#)
SPI_FLASH6_CS: R?#43.1 U?#12.10(Y5) U?#14.C2(S#)
SPI_FLASH7_CS: R?#54.1 U?#12.9(Y6) U?#15.C2(S#)
SPI_FLASH8_CS: R?#58.1 U?#12.7(Y7) U?#16.C2(S#)
SPI_FLASH_CLK: R?#16.1 R?#17.1 R?#30.1 R?#32.1 R?#33.1 R?#48.1 R?#49.1 R?#62.1 R?#63.1 ; port SPI_FLASH_CLK
SPI_FLASH_MISO: R?#20.1 R?#21.1 R?#31.1 R?#36.1 R?#37.1 R?#52.1 R?#53.1 R?#66.1 R?#67.1 ; port SPI_FLASH_MISO
SPI_FLASH_MOSI: R?#18.1 R?#19.1 R?#34.1 R?#35.1 R?#38.2 R?#50.1 R?#51.1 R?#64.1 R?#65.1 ; port SPI_FLASH_MOSI
NetR?#9_1: R?#9.1 U?#8.A4(RESET#)
NetR?#10_1: R?#10.1 U?#8.D4(DQ3/HOLD#)
NetR?#11_1: R?#11.1 U?#8.C4(W#/DQ2)
NetR?#13_1: R?#13.1 U?#9.A4(RESET#)
NetR?#14_1: R?#14.1 U?#9.D4(DQ3/HOLD#)
NetR?#15_1: R?#15.1 U?#9.C4(W#/DQ2)
NetR?#16_2: R?#16.2 U?#8.B2(C)
NetR?#17_2: R?#17.2 U?#9.B2(C)
NetR?#18_2: R?#18.2 U?#8.D3(DQ0)
NetR?#19_2: R?#19.2 U?#9.D3(DQ0)
NetR?#20_2: R?#20.2 U?#8.D2(DQ1)
NetR?#21_2: R?#21.2 U?#9.D2(DQ1)
NetR?#23_1: R?#23.1 U?#10.A4(RESET#)
NetR?#24_1: R?#24.1 U?#10.D4(DQ3/HOLD#)
NetR?#25_1: R?#25.1 U?#10.C4(W#/DQ2)
NetR?#27_1: R?#27.1 U?#11.A4(RESET#)
NetR?#28_1: R?#28.1 U?#11.D4(DQ3/HOLD#)
NetR?#29_1: R?#29.1 U?#11.C4(W#/DQ2)
NetR?#32_2: R?#32.2 U?#10.B2(C)
NetR?#33_2: R?#33.2 U?#11.B2(C)
NetR?#34_2: R?#34.2 U?#10.D3(DQ0)
NetR?#35_2: R?#35.2 U?#11.D3(DQ0)
NetR?#36_2: R?#36.2 U?#10.D2(DQ1)
NetR?#37_2: R?#37.2 U?#11.D2(DQ1)
NetR?#40_1: R?#40.1 U?#13.A4(RESET#)
NetR?#41_1: R?#41.1 U?#13.D4(DQ3/HOLD#)
NetR?#42_1: R?#42.1 U?#13.C4(W#/DQ2)
NetR?#44_1: R?#44.1 U?#14.A4(RESET#)
NetR?#45_1: R?#45.1 U?#14.D4(DQ3/HOLD#)
NetR?#46_1: R?#46.1 U?#14.C4(W#/DQ2)
NetR?#48_2: R?#48.2 U?#13.B2(C)
NetR?#49_2: R?#49.2 U?#14.B2(C)
NetR?#50_2: R?#50.2 U?#13.D3(DQ0)
NetR?#51_2: R?#51.2 U?#14.D3(DQ0)
NetR?#52_2: R?#52.2 U?#13.D2(DQ1)
NetR?#53_2: R?#53.2 U?#14.D2(DQ1)
NetR?#55_1: R?#55.1 U?#15.A4(RESET#)
NetR?#56_1: R?#56.1 U?#15.D4(DQ3/HOLD#)
NetR?#57_1: R?#57.1 U?#15.C4(W#/DQ2)
NetR?#59_1: R?#59.1 U?#16.A4(RESET#)
NetR?#60_1: R?#60.1 U?#16.D4(DQ3/HOLD#)
NetR?#61_1: R?#61.1 U?#16.C4(W#/DQ2)
NetR?#62_2: R?#62.2 U?#15.B2(C)
NetR?#63_2: R?#63.2 U?#16.B2(C)
NetR?#64_2: R?#64.2 U?#15.D3(DQ0)
NetR?#65_2: R?#65.2 U?#16.D3(DQ0)
NetR?#66_2: R?#66.2 U?#15.D2(DQ1)
NetR?#67_2: R?#67.2 U?#16.D2(DQ1)

Not connected (* = marked no-connect by the designer): U?#8 A2(NC) A3(RFU) A5(RFU) B1(RFU) B5(RFU) C1(RFU) C3(RFU) C5(RFU) D1(RFU) D5(RFU) E1(RFU) E2(RFU) E3(RFU) E4(RFU) E5(RFU); U?#9 A2(NC) A3(RFU) A5(RFU) B1(RFU) B5(RFU) C1(RFU) C3(RFU) C5(RFU) D1(RFU) D5(RFU) E1(RFU) E2(RFU) E3(RFU) E4(RFU) E5(RFU); U?#10 A2(NC) A3(RFU) A5(RFU) B1(RFU) B5(RFU) C1(RFU) C3(RFU) C5(RFU) D1(RFU) D5(RFU) E1(RFU) E2(RFU) E3(RFU) E4(RFU) E5(RFU); U?#11 A2(NC) A3(RFU) A5(RFU) B1(RFU) B5(RFU) C1(RFU) C3(RFU) C5(RFU) D1(RFU) D5(RFU) E1(RFU) E2(RFU) E3(RFU) E4(RFU) E5(RFU); U?#13 A2(NC) A3(RFU) A5(RFU) B1(RFU) B5(RFU) C1(RFU) C3(RFU) C5(RFU) D1(RFU) D5(RFU) E1(RFU) E2(RFU) E3(RFU) E4(RFU) E5(RFU); U?#14 A2(NC) A3(RFU) A5(RFU) B1(RFU) B5(RFU) C1(RFU) C3(RFU) C5(RFU) D1(RFU) D5(RFU) E1(RFU) E2(RFU) E3(RFU) E4(RFU) E5(RFU); U?#15 A2(NC) A3(RFU) A5(RFU) B1(RFU) B5(RFU) C1(RFU) C3(RFU) C5(RFU) D1(RFU) D5(RFU) E1(RFU) E2(RFU) E3(RFU) E4(RFU) E5(RFU); U?#16 A2(NC) A3(RFU) A5(RFU) B1(RFU) B5(RFU) C1(RFU) C3(RFU) C5(RFU) D1(RFU) D5(RFU) E1(RFU) E2(RFU) E3(RFU) E4(RFU) E5(RFU)

### Notes on the sheet
- (near R?#11) FLASH MEMORY
- Title
- Size:
- A3
- Number:
- Revision:
- Date:
- Time:
- Sheet
- of

### Library data of the parts
C?#42-C?#51 = CMP-001-1980-1: as C?#5 on sheet MCU; Height max: 550µm; ComponentLink3Description: Digikey; Mounting Type: SM; ComponentLink3URL: https://www.digikey.com/en/products/detail/murata-electronics/GCM155L8EH104KE07D/11618823; Package: 0402 (1005 Metric); Lead Spacing: 0mm; MPN: GCM155L8EH104KE07D; Size: 1.00mm x 0.50mm; Ratings: AEC-Q200; ComponentLink1URL: https://search.murata.co.jp/Ceramy/image/img/A01X/G101/ENG/GCM155L8EH104KE07-01.pdf; ComponentLink1Description: Datasheet; Dielectric: X8L; ComponentLink2Description: Mouser; ComponentLink2URL: https://eu.mouser.com/ProductDetail/Murata-Electronics/GCM155L8EH104KE07D?qs=1mbolxNpo8fQSHf0HYnZWw%3D%3D
FB?#4 = CMP-001-1981-1: as FB?#1 on sheet MCU; Mounting Type: SM; Size: 1.60mm x 0.80mm; ComponentLink2URL: https://eu.mouser.com/ProductDetail/Murata-Electronics/BLM18KG221BH1D?qs=sJ5gq5MLFXpgEHYBdWUtkQ%3D%3D; ComponentLink1Description: Datasheet; ComponentLink1URL: https://www.murata.com/en-us/products/productdata/8798137286686/QNFA9129.pdf; Lead Spacing: 0mm; Ratings: AEC-Q200; ComponentLink3Description: Digikey; ComponentLink3URL: https://www.digikey.com/en/products/detail/murata-electronics/BLM18KG221BH1D/6156000; Height max: 950µm; Package: 0603 (1608 Metric); ComponentLink2Description: Mouser; MPN: BLM18KG221BH1D
R?#8-R?#15 R?#22-R?#31 R?#38-R?#47 R?#54-R?#61 = CMP-001-0277-7: RES 47.5K OHM 1% 1/16W 0402; Manufacturer: YAGEO; Op Temp min: -55°C; Power: 63mW; Temperature Coefficient: ±100ppm; Op Temp max: 155°C; ComponentLink1URL: https://www.yageo.com/upload/media/product/productsearch/datasheet/rchip/PYu-RC_Group_51_RoHS_L_12.pdf; ComponentLink1Description: Datasheet; MPN: RC0402FR-0747K5L; ComponentLink3Description: Digikey; ComponentLink2URL: https://eu.mouser.com/ProductDetail/YAGEO/RC0402FR-0747K5L?qs=V1yeUXFNrklfu86Rfgihxg%3D%3D; Mounting Type: SM; Tolerance: 1%; Package: 0402 (1005 Metric); Height max: 400µm; ComponentLink2Description: Mouser; ComponentLink3URL: https://www.digikey.com/en/products/detail/yageo/RC0402FR-0747K5L/726617; Size: 1.00mm x 0.50mm; Composition: Thick Film; Ratings: -
R?#16-R?#21 R?#32-R?#37 R?#48-R?#53 R?#62-R?#67 = CMP-001-0482-4: RES 22 OHM 1% 1/16W 0402; Manufacturer: YAGEO; Temperature Coefficient: ±100ppm; Op Temp max: 155°C; Op Temp min: -55°C; Power: 63mW; Ratings: -; ComponentLink3URL: https://www.digikey.com/en/products/detail/yageo/RC0402FR-0722RL/726562; ComponentLink2URL: https://eu.mouser.com/ProductDetail/YAGEO/RC0402FR-0722RL?qs=V1yeUXFNrkkRg6zf08ADKQ%3D%3D; MPN: RC0402FR-0722RL; ComponentLink1Description: Datasheet; ComponentLink3Description: Digikey; Tolerance: 1%; Size: 1.00mm x 0.50mm; ComponentLink1URL: https://www.yageo.com/upload/media/product/productsearch/datasheet/rchip/PYu-RC_Group_51_RoHS_L_12.pdf; Composition: Thick Film; ComponentLink2Description: Mouser; Mounting Type: SM; Package: 0402 (1005 Metric); Height max: 400µm
U?#8-U?#11 U?#13-U?#16 = MT25QL01GBBB8E12-0AUT: IC FLASH 1GBIT SPI 24TPBGA; Manufacturer: Micron Technology Inc.; MPN: MT25QL01GBBB8E12-0AUT
U?#12 = SN74LVC138AMPWTEP: IC DECODER/DEMUX 1X3:8 16-TSSOP; Manufacturer: Texas Instruments; MPN: SN74LVC138AMPWTEP

## Sheet EEPROM_memory.SchDoc: =DT_SCH_Title
size A4; Organization: Droid Technologies; DocumentNumber: DT10965; Revision: 1.0; SheetNumber: 6; SheetTotal: 15
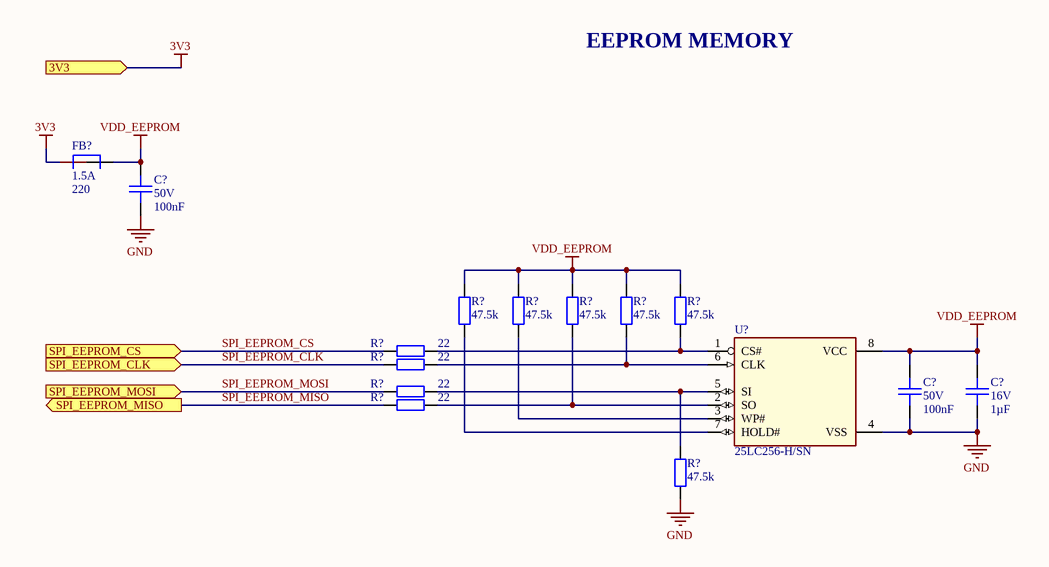
[diagram p3: EEPROM_memory.SchDoc]

### Parts
(Parts that share a designator on the sheet are numbered #1, #2 ... from top to bottom, then left to right.)
C?#52  Voltage Rating: 50V  Capacitance: 100nF  [CAPC100x50x50L25]  (hidden comment: GCM155L8EH104KE07D)
C?#53  Voltage Rating: 50V  Capacitance: 100nF  [CAPC100x50x50L25]  (hidden comment: GCM155L8EH104KE07D)
C?#54  Voltage Rating: 16V  Capacitance: 1µF  [CAPC160X80X90L35]  (hidden comment: GCG188L8EE105KA07D)
FB?#5  Imax: 1.5A  Impedance: 220  [BEADC160X80X95L40]  (hidden comment: BLM18KG221BH1D)
R?#68  Resistance: 47.5k  [RESC100X50X40L25]  (hidden comment: RC0402FR-0747K5L)
R?#69  Resistance: 47.5k  [RESC100X50X40L25]  (hidden comment: RC0402FR-0747K5L)
R?#70  Resistance: 47.5k  [RESC100X50X40L25]  (hidden comment: RC0402FR-0747K5L)
R?#71  Resistance: 47.5k  [RESC100X50X40L25]  (hidden comment: RC0402FR-0747K5L)
R?#72  Resistance: 47.5k  [RESC100X50X40L25]  (hidden comment: RC0402FR-0747K5L)
R?#73  Resistance: 22  [RESC100X50X40L25]  (hidden comment: RC0402FR-0722RL)
R?#74  Resistance: 22  [RESC100X50X40L25]  (hidden comment: RC0402FR-0722RL)
R?#75  Resistance: 22  [RESC100X50X40L25]  (hidden comment: RC0402FR-0722RL)
R?#76  Resistance: 22  [RESC100X50X40L25]  (hidden comment: RC0402FR-0722RL)
R?#77  Resistance: 47.5k  [RESC100X50X40L25]  (hidden comment: RC0402FR-0747K5L)
U?#17  25LC256-H/SN  [SOIC8P127_490X600X175L70X41]

### Ports
3V3 (in), SPI_EEPROM_CLK (in), SPI_EEPROM_CS (in), SPI_EEPROM_MISO (out), SPI_EEPROM_MOSI (in)

### Nets
3V3: FB?#5.1 ; port 3V3
GND: C?#52.1 C?#53.1 C?#54.1 R?#77.1 U?#17.4(VSS)
VDD_EEPROM: C?#52.2 C?#53.2 C?#54.2 FB?#5.2 R?#68.2 R?#69.2 R?#70.2 R?#71.2 R?#72.2 U?#17.8(VCC)
SPI_EEPROM_CLK: R?#74.1 ; port SPI_EEPROM_CLK
SPI_EEPROM_CS: R?#73.1 ; port SPI_EEPROM_CS
SPI_EEPROM_MISO: R?#76.1 ; port SPI_EEPROM_MISO
SPI_EEPROM_MOSI: R?#75.1 ; port SPI_EEPROM_MOSI
NetR?#68_1: R?#68.1 U?#17.7(HOLD#)
NetR?#69_1: R?#69.1 U?#17.3(WP#)
NetR?#70_1: R?#70.1 R?#76.2 U?#17.2(SO)
NetR?#71_1: R?#71.1 R?#74.2 U?#17.6(CLK)
NetR?#72_1: R?#72.1 R?#73.2 U?#17.1(CS#)
NetR?#75_2: R?#75.2 R?#77.2 U?#17.5(SI)

### Notes on the sheet
- EEPROM MEMORY
- Title
- Size:
- A4
- Number:
- Revision:
- Date:
- Time:
- Sheet
- of

### Library data of the parts
C?#52 C?#53 = CMP-001-1980-1: as C?#5 on sheet MCU; Height max: 550µm; ComponentLink3Description: Digikey; Mounting Type: SM; ComponentLink3URL: https://www.digikey.com/en/products/detail/murata-electronics/GCM155L8EH104KE07D/11618823; Package: 0402 (1005 Metric); Lead Spacing: 0mm; MPN: GCM155L8EH104KE07D; Size: 1.00mm x 0.50mm; Ratings: AEC-Q200; ComponentLink1URL: https://search.murata.co.jp/Ceramy/image/img/A01X/G101/ENG/GCM155L8EH104KE07-01.pdf; ComponentLink1Description: Datasheet; Dielectric: X8L; ComponentLink2Description: Mouser; ComponentLink2URL: https://eu.mouser.com/ProductDetail/Murata-Electronics/GCM155L8EH104KE07D?qs=1mbolxNpo8fQSHf0HYnZWw%3D%3D
C?#54 = CMP-001-1982-1: CAP CER 1UF 16V X8L 0603; Manufacturer: Murata Electronics; Tolerance: 10%; Op Temp min: -55°C; Op Temp max: 150°C; ComponentLink3URL: https://www.digikey.com/en/products/detail/murata-electronics/GCG188L8EE105KA07D/10695125; Package: 0603 (1608 Metric); MPN: GCG188L8EE105KA07D; ComponentLink2URL: https://eu.mouser.com/ProductDetail/Murata-Electronics/GCG188L8EE105KA07D?qs=rrS6PyfT74dFMfTR80dVTA%3D%3D; Dielectric: X8L; Size: 1.60mm x 0.80mm; ComponentLink1Description: Datasheet; ComponentLink1URL: https://search.murata.co.jp/Ceramy/image/img/A01X/G101/ENG/GCG188L8EE105KA07-01.pdf; ComponentLink2Description: Mouser; Height max: 900µm; Mounting Type: SM; ComponentLink3Description: Digikey; Lead Spacing: 0mm; Ratings: AEC-Q200
FB?#5 = CMP-001-1981-1: as FB?#1 on sheet MCU; Mounting Type: SM; Size: 1.60mm x 0.80mm; ComponentLink2URL: https://eu.mouser.com/ProductDetail/Murata-Electronics/BLM18KG221BH1D?qs=sJ5gq5MLFXpgEHYBdWUtkQ%3D%3D; ComponentLink1Description: Datasheet; ComponentLink1URL: https://www.murata.com/en-us/products/productdata/8798137286686/QNFA9129.pdf; Lead Spacing: 0mm; Ratings: AEC-Q200; ComponentLink3Description: Digikey; ComponentLink3URL: https://www.digikey.com/en/products/detail/murata-electronics/BLM18KG221BH1D/6156000; Height max: 950µm; Package: 0603 (1608 Metric); ComponentLink2Description: Mouser; MPN: BLM18KG221BH1D
R?#68-R?#72 R?#77 = CMP-001-0277-7: as R?#8 on sheet Flash_memory; ComponentLink1URL: https://www.yageo.com/upload/media/product/productsearch/datasheet/rchip/PYu-RC_Group_51_RoHS_L_12.pdf; ComponentLink1Description: Datasheet; MPN: RC0402FR-0747K5L; ComponentLink3Description: Digikey; ComponentLink2URL: https://eu.mouser.com/ProductDetail/YAGEO/RC0402FR-0747K5L?qs=V1yeUXFNrklfu86Rfgihxg%3D%3D; Mounting Type: SM; Tolerance: 1%; Package: 0402 (1005 Metric); Height max: 400µm; ComponentLink2Description: Mouser; ComponentLink3URL: https://www.digikey.com/en/products/detail/yageo/RC0402FR-0747K5L/726617; Size: 1.00mm x 0.50mm; Composition: Thick Film; Ratings: -
R?#73-R?#76 = CMP-001-0482-4: as R?#16 on sheet Flash_memory; Ratings: -; ComponentLink3URL: https://www.digikey.com/en/products/detail/yageo/RC0402FR-0722RL/726562; ComponentLink2URL: https://eu.mouser.com/ProductDetail/YAGEO/RC0402FR-0722RL?qs=V1yeUXFNrkkRg6zf08ADKQ%3D%3D; MPN: RC0402FR-0722RL; ComponentLink1Description: Datasheet; ComponentLink3Description: Digikey; Tolerance: 1%; Size: 1.00mm x 0.50mm; ComponentLink1URL: https://www.yageo.com/upload/media/product/productsearch/datasheet/rchip/PYu-RC_Group_51_RoHS_L_12.pdf; Composition: Thick Film; ComponentLink2Description: Mouser; Mounting Type: SM; Package: 0402 (1005 Metric); Height max: 400µm
U?#17 = 25LC256-H/SN: IC EEPROM 256KBIT SPI 5MHZ 8SOIC; Manufacturer: Microchip Technology; MPN: 25LC256-H/SN

## Sheet Temp_sensor.SchDoc: =DT_SCH_Title
size A4; Organization: Droid Technologies; DocumentNumber: DT10965; Revision: 1.0; SheetNumber: 7; SheetTotal: 14
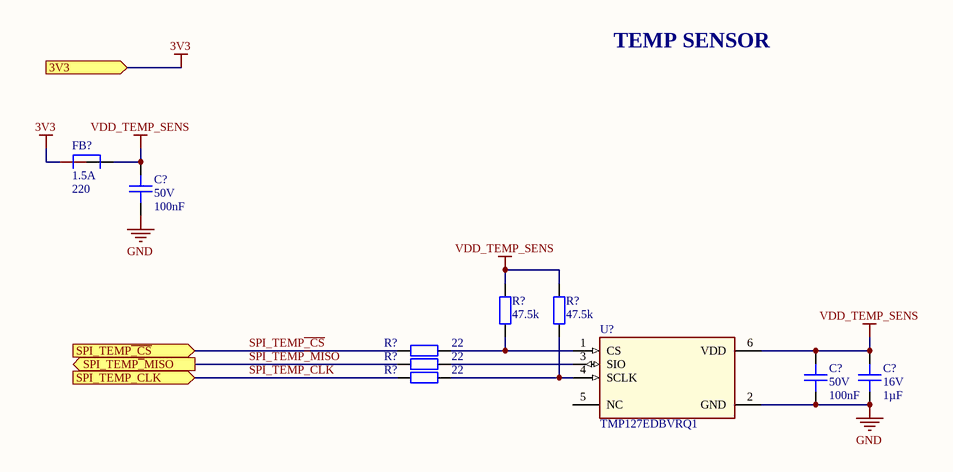
[diagram p4: Temp_sensor.SchDoc]

### Parts
(Parts that share a designator on the sheet are numbered #1, #2 ... from top to bottom, then left to right.)
C?#55  Voltage Rating: 50V  Capacitance: 100nF  [CAPC100x50x50L25]  (hidden comment: GCM155L8EH104KE07D)
C?#56  Voltage Rating: 50V  Capacitance: 100nF  [CAPC100x50x50L25]  (hidden comment: GCM155L8EH104KE07D)
C?#57  Voltage Rating: 16V  Capacitance: 1µF  [CAPC160X80X90L35]  (hidden comment: GCG188L8EE105KA07D)
FB?#6  Imax: 1.5A  Impedance: 220  [BEADC160X80X95L40]  (hidden comment: BLM18KG221BH1D)
R?#78  Resistance: 47.5k  [RESC100X50X40L25]  (hidden comment: RC0402FR-0747K5L)
R?#79  Resistance: 47.5k  [RESC100X50X40L25]  (hidden comment: RC0402FR-0747K5L)
R?#80  Resistance: 22  [RESC100X50X40L25]  (hidden comment: RC0402FR-0722RL)
R?#81  Resistance: 22  [RESC100X50X40L25]  (hidden comment: RC0402FR-0722RL)
R?#82  Resistance: 22  [RESC100X50X40L25]  (hidden comment: RC0402FR-0722RL)
U?#18  TMP127EDBVRQ1  [SOT-23-6]

### Ports
3V3 (in), SPI_TEMP_CLK (in), SPI_TEMP~{_CS} (in), SPI_TEMP~{_}MISO (out)

### Nets
3V3: FB?#6.1 ; port 3V3
GND: C?#55.1 C?#56.1 C?#57.1 U?#18.2(GND)
VDD_TEMP_SENS: C?#55.2 C?#56.2 C?#57.2 FB?#6.2 R?#78.2 R?#79.2 U?#18.6(VDD)
SPI_TEMP~{_CS}: R?#80.1 ; port SPI_TEMP~{_CS}
SPI_TEMP~{_}MISO: R?#81.1 ; port SPI_TEMP~{_}MISO
SPI_TEMP_CLK: R?#82.1 ; port SPI_TEMP_CLK
NetR?#78_1: R?#78.1 R?#80.2 U?#18.1(CS)
NetR?#79_1: R?#79.1 R?#82.2 U?#18.4(SCLK)
NetR?#81_2: R?#81.2 U?#18.3(SIO)

Not connected (* = marked no-connect by the designer): U?#18 5(NC)

### Notes on the sheet
- TEMP SENSOR
- Title
- Size:
- A4
- Number:
- Revision:
- Date:
- Time:
- Sheet
- of

### Library data of the parts
C?#55 C?#56 = CMP-001-1980-1: as C?#5 on sheet MCU; Height max: 550µm; ComponentLink3Description: Digikey; Mounting Type: SM; ComponentLink3URL: https://www.digikey.com/en/products/detail/murata-electronics/GCM155L8EH104KE07D/11618823; Package: 0402 (1005 Metric); Lead Spacing: 0mm; MPN: GCM155L8EH104KE07D; Size: 1.00mm x 0.50mm; Ratings: AEC-Q200; ComponentLink1URL: https://search.murata.co.jp/Ceramy/image/img/A01X/G101/ENG/GCM155L8EH104KE07-01.pdf; ComponentLink1Description: Datasheet; Dielectric: X8L; ComponentLink2Description: Mouser; ComponentLink2URL: https://eu.mouser.com/ProductDetail/Murata-Electronics/GCM155L8EH104KE07D?qs=1mbolxNpo8fQSHf0HYnZWw%3D%3D
C?#57 = CMP-001-1982-1: as C?#54 on sheet EEPROM_memory; ComponentLink3URL: https://www.digikey.com/en/products/detail/murata-electronics/GCG188L8EE105KA07D/10695125; Package: 0603 (1608 Metric); MPN: GCG188L8EE105KA07D; ComponentLink2URL: https://eu.mouser.com/ProductDetail/Murata-Electronics/GCG188L8EE105KA07D?qs=rrS6PyfT74dFMfTR80dVTA%3D%3D; Dielectric: X8L; Size: 1.60mm x 0.80mm; ComponentLink1Description: Datasheet; ComponentLink1URL: https://search.murata.co.jp/Ceramy/image/img/A01X/G101/ENG/GCG188L8EE105KA07-01.pdf; ComponentLink2Description: Mouser; Height max: 900µm; Mounting Type: SM; ComponentLink3Description: Digikey; Lead Spacing: 0mm; Ratings: AEC-Q200
FB?#6 = CMP-001-1981-1: as FB?#1 on sheet MCU; Mounting Type: SM; Size: 1.60mm x 0.80mm; ComponentLink2URL: https://eu.mouser.com/ProductDetail/Murata-Electronics/BLM18KG221BH1D?qs=sJ5gq5MLFXpgEHYBdWUtkQ%3D%3D; ComponentLink1Description: Datasheet; ComponentLink1URL: https://www.murata.com/en-us/products/productdata/8798137286686/QNFA9129.pdf; Lead Spacing: 0mm; Ratings: AEC-Q200; ComponentLink3Description: Digikey; ComponentLink3URL: https://www.digikey.com/en/products/detail/murata-electronics/BLM18KG221BH1D/6156000; Height max: 950µm; Package: 0603 (1608 Metric); ComponentLink2Description: Mouser; MPN: BLM18KG221BH1D
R?#78 R?#79 = CMP-001-0277-7: as R?#8 on sheet Flash_memory; ComponentLink1URL: https://www.yageo.com/upload/media/product/productsearch/datasheet/rchip/PYu-RC_Group_51_RoHS_L_12.pdf; ComponentLink1Description: Datasheet; MPN: RC0402FR-0747K5L; ComponentLink3Description: Digikey; ComponentLink2URL: https://eu.mouser.com/ProductDetail/YAGEO/RC0402FR-0747K5L?qs=V1yeUXFNrklfu86Rfgihxg%3D%3D; Mounting Type: SM; Tolerance: 1%; Package: 0402 (1005 Metric); Height max: 400µm; ComponentLink2Description: Mouser; ComponentLink3URL: https://www.digikey.com/en/products/detail/yageo/RC0402FR-0747K5L/726617; Size: 1.00mm x 0.50mm; Composition: Thick Film; Ratings: -
R?#80-R?#82 = CMP-001-0482-4: as R?#16 on sheet Flash_memory; Ratings: -; ComponentLink3URL: https://www.digikey.com/en/products/detail/yageo/RC0402FR-0722RL/726562; ComponentLink2URL: https://eu.mouser.com/ProductDetail/YAGEO/RC0402FR-0722RL?qs=V1yeUXFNrkkRg6zf08ADKQ%3D%3D; MPN: RC0402FR-0722RL; ComponentLink1Description: Datasheet; ComponentLink3Description: Digikey; Tolerance: 1%; Size: 1.00mm x 0.50mm; ComponentLink1URL: https://www.yageo.com/upload/media/product/productsearch/datasheet/rchip/PYu-RC_Group_51_RoHS_L_12.pdf; Composition: Thick Film; ComponentLink2Description: Mouser; Mounting Type: SM; Package: 0402 (1005 Metric); Height max: 400µm
U?#18 = TMP127EDBVRQ1: AUTOMOTIVE 0.8C SPI TEMPERATURE; Manufacturer: Texas Instruments; MPN: TMP127EDBVRQ1